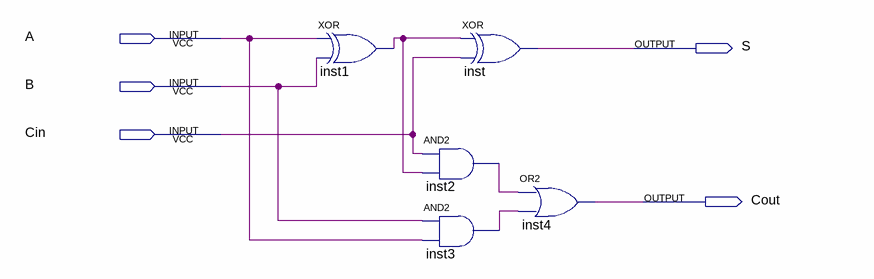
[diagram p0: schematic sheet]
// Quartus schematic Full_adder.bdf as structural Verilog: 5 symbols, 5 pins
module Full_adder (
  input  A,
  input  B,
  input  Cin,
  output S,
  output Cout
);

  wire inst1_out, inst2_out, inst3_out;

  xor inst1 (inst1_out, A, B);
  xor inst (S, inst1_out, Cin);
  and inst2 (inst2_out, Cin, inst1_out);
  and inst3 (inst3_out, B, A);
  or inst4 (Cout, inst2_out, inst3_out);
endmodule
